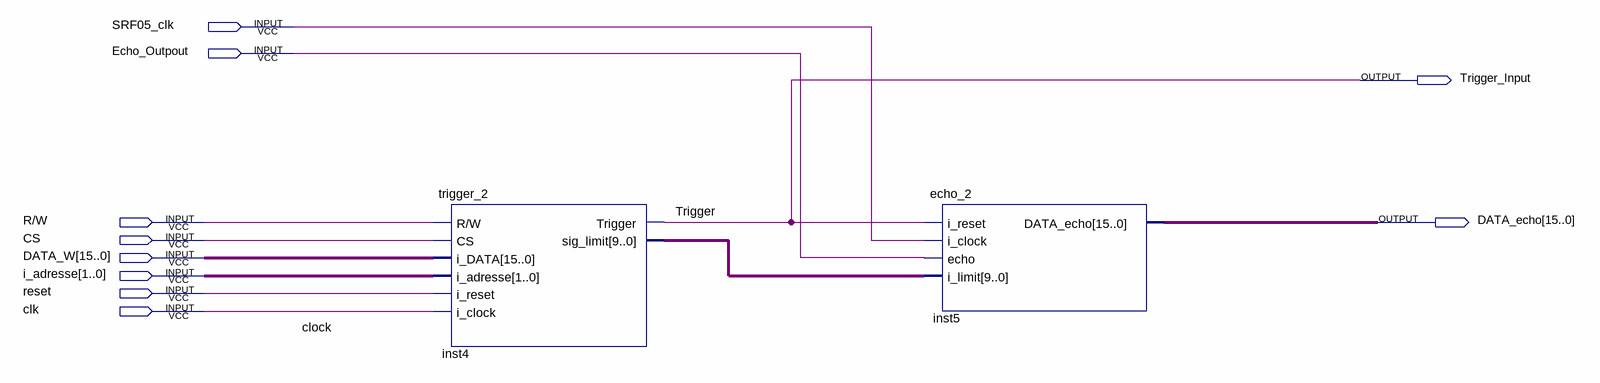
[diagram p0: schematic sheet]
// Quartus schematic Capteur_SRF05.bdf as structural Verilog: 2 symbols, 10 pins
module Capteur_SRF05 (
  input  SRF05_clk,
  input  Echo_Outpout,
  input  \R/W ,
  input  CS,
  input  [15:0] DATA_W,
  input  [1:0] i_adresse,
  input  reset,
  input  clk,
  output Trigger_Input,
  output [15:0] DATA_echo
);

  wire [9:0] inst4_sig_limit;

  trigger_2 inst4 (
    .\R/W (\R/W ), .CS(CS), .i_DATA(DATA_W), .i_adresse(i_adresse), .i_reset(reset), .i_clock(clk),
    .Trigger(Trigger_Input), .sig_limit(inst4_sig_limit));
  echo_2 inst5 (
    .i_reset(Trigger_Input), .i_clock(SRF05_clk), .echo(Echo_Outpout), .i_limit(inst4_sig_limit),
    .DATA_echo(DATA_echo));

  // Other names for the same wires on the sheet: clock = clk; Trigger = Trigger_Input
endmodule
